# Altium schematic sheet Power_20_12V.SchDoc
size A4
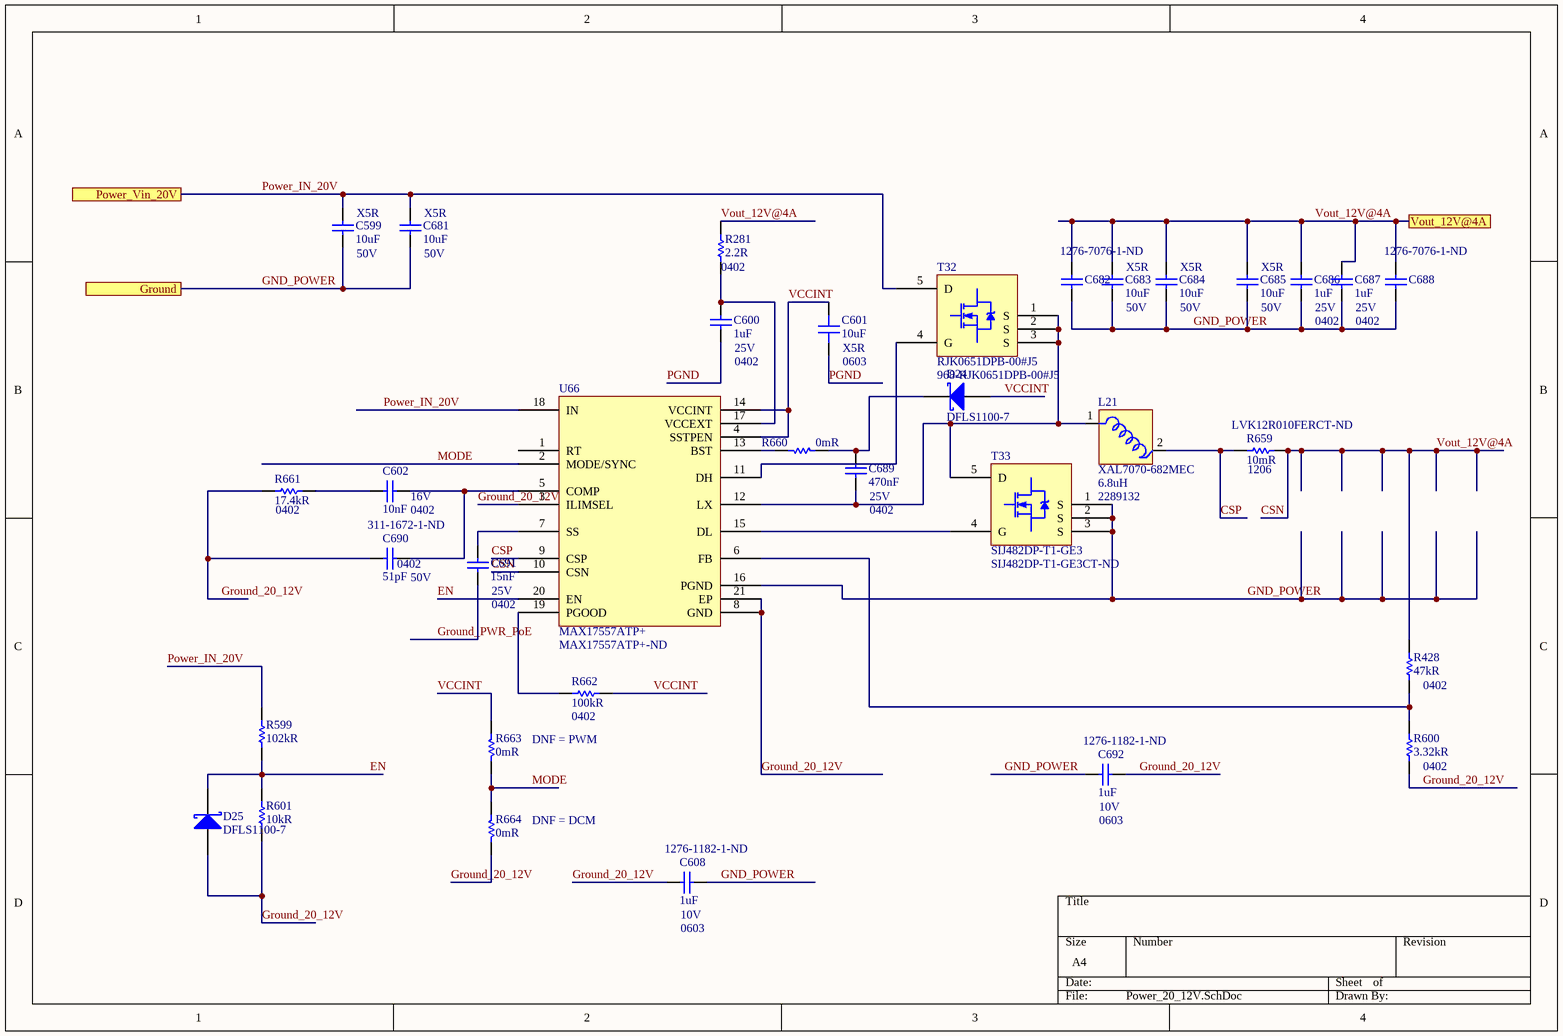
[diagram p0: Power_20_12V.SchDoc]

## Parts
C599  10uF  Voltage Rating (DC): 50V  Dielectric: X5R  [CAP 0805/2012 RF]
C600  1uF  Case/Package: 0402  Voltage Rating: 25V  [CAP 0402/1005 RF]
C601  10uF  Case/Package: 0603  Dielectric: X5R  [CAP 0603/1608 RF]
C602  10nF  Case/Package: 0402  Voltage Rating: 16V  [CAP 0402/1005 RF]
C608  1uF  Supplier Part Number 1: 1276-1182-1-ND  Case/Package: 0603  Voltage Rating: 10V  [CAP 0603/1608 RF]
C681  10uF  Voltage Rating (DC): 50V  Dielectric: X5R  [CAP 0805/2012 RF]
C682  Supplier Part Number 1: 1276-7076-1-ND  [CAP 0603/1608 RF]  (hidden comment: 22uF)
C683  10uF  Voltage Rating (DC): 50V  Dielectric: X5R  [CAP 0805/2012 RF]
C684  10uF  Voltage Rating (DC): 50V  Dielectric: X5R  [CAP 0805/2012 RF]
C685  10uF  Voltage Rating (DC): 50V  Dielectric: X5R  [CAP 0805/2012 RF]
C686  1uF  Case/Package: 0402  Voltage Rating: 25V  [CAP 0402/1005 RF]
C687  1uF  Case/Package: 0402  Voltage Rating: 25V  [CAP 0402/1005 RF]
C688  Supplier Part Number 1: 1276-7076-1-ND  [CAP 0603/1608 RF]  (hidden comment: 22uF)
C689  470nF  Case/Package: 0402  Voltage Rating: 25V  [CAP 0402/1005 RF]
C690  51pF  Supplier Part Number 1: 311-1672-1-ND  Case/Package: 0402  Voltage Rating: 50V  [CAP 0402/1005 RF]
C691  15nF  Case/Package: 0402  Voltage Rating: 25V  [CAP 0402/1005 RF]
C692  1uF  Supplier Part Number 1: 1276-1182-1-ND  Case/Package: 0603  Voltage Rating: 10V  [CAP 0603/1608 RF]
D24  DFLS1100-7  [DFLS1100]
D25  DFLS1100-7  [DFLS1100]
L21  XAL7070-682MEC  Inductance: 6.8uH  Supplier Part Number 1: 2289132
R281  2.2R  Case Code (Imperial): 0402  [RES 0402/1005 RF]
R428  47kR  Case/Package: 0402  [RES 0402/1005 RF]
R599  102kR  [RES 1206/3216]
R600  3.32kR  Case/Package: 0402  [RES 0402/1005 RF]
R601  10kR  [RES 0402/1005 RF]
R659  10mR  Supplier Part Number 1: LVK12R010FERCT-ND  Case/Package: 1206  [RES 1206/3216]
R660  0mR  [RES 0402/1005 RF]
R661  17.4kR  Case/Package: 0402  [RES 0402/1005 RF]
R662  100kR  Case/Package: 0402  [RES 0402/1005 RF]
R663  0mR  [RES 0402/1005 RF]
R664  0mR  [RES 0402/1005 RF]
T32  RJK0651DPB-00#J5  Supplier Part Number 1: 968-RJK0651DPB-00#J5  [RJK0651DPB]
T33  SIJ482DP-T1-GE3  Supplier Part Number 1: SIJ482DP-T1-GE3CT-ND  [SiJ482DP]
U66  MAX17557ATP+  Supplier Part Number 1: MAX17557ATP+-ND  [MAX17557]

## Ports
Ground, Power_Vin_20V, Vout_12V@4A

## Nets
CSN: C682.2 C683.2 C684.2 C685.2 C686.2 C687.2 C688.2 R281.2 R428.2 R659.2 U66.10(CSN) ; port Vout_12V@4A  [also labelled Vout_12V@4A]
CSP: L21.2 R659.1 U66.9(CSP)
EN: D25.1(K) R599.1 R601.1 U66.20(EN)
GND_POWER: C599.1 C608.2 C681.1 C682.1 C683.1 C684.1 C685.1 C686.1 C687.1 C688.1 C692.1 T33.1(S) T33.2(S) T33.3(S) U66.16(PGND) ; port Ground
Ground_20_12V: C608.1 C690.2 C692.2 D25.2(A) R600.1 R601.2 R661.1 R664.2 U66.3(ILIMSEL) U66.8(GND) U66.21(EP)
Ground_PWR_PoE: C691.1
MODE: R663.2 R664.1 U66.2(MODE/SYNC)
PGND: C600.1 C601.1
Power_IN_20V: C599.2 C681.2 R599.2 T32.5(D) U66.18(IN) ; port Power_Vin_20V
VCCINT: C601.2 D24.2(A) R662.1 R663.1 U66.4(SSTPEN) U66.14(VCCINT)
NetC600_2: C600.2 R281.1 U66.17(VCCEXT)
NetC602_1: C602.1 R661.2
NetC602_2: C602.2 C690.1 U66.5(COMP)
NetC689_1: C689.1 L21.1 T32.1(S) T32.2(S) T32.3(S) T33.5(D) U66.12(LX)
NetC689_2: C689.2 D24.1(K) R660.1
NetC691_2: C691.2 U66.7(SS)
NetR428_1: R428.1 R600.2 U66.6(FB)
NetR660_2: R660.2 U66.13(BST)
NetR662_2: R662.2 U66.19(PGOOD)
NetT32_4: T32.4(G) U66.11(DH)
NetT33_4: T33.4(G) U66.15(DL)

Not connected (* = marked no-connect by the designer): U66 1(RT)

## Notes on the sheet
- DNF = PWM
- (near R664) DNF = DCM

## Library data of the parts
C599 C681 C683-C685 = Capacitor: Manufacturer: Murata; Manufacturer Part Number: GRM21BR61H106KE43L; Tolerance: 10%; Supplier 1: Digi-Key; Supplier Part Number 1: 490-18663-1-ND; RoHS: No; Category: Ceramic Capacitors; Stock 1: 3437; Pricing 1: 1=0,49000, 10=0,33800, 100=0,20270, 500=0,15198, 1000=0,12835 (USD); Capacitance: 10uF; Length: 2mm; Width: 1.25mm; Thickness: 1.25mm
C600 C686 C687 = Capacitor: MURATA - GRT155R61E105KE01D - SMD Multilayer Ceramic Capacitor, 1 µF, 25 V, 0402 [1005 Metric], ± 10%, X5R, GRT Series - SMD Multilayer Ceramic Capacitor, 1 µF, 25 V, 0402 [1005 Metric], ± 10%, X5R, GRT Series; Supplier 1: Digi-Key; Supplier Part Number 1: 490-12263-1-ND; Manufacturer: Murata; Manufacturer Part Number: GRT155R61E105KE01D; RoHS: Yes; Category: Ceramic Capacitors; Stock 1: 341453; Pricing 1: 1=0,18000, 10=0,12300, 100=0,06210, 500=0,04248, 1000=0,03758, 2500=0,03594, 5000=0,03268 (USD); Mount: Surface Mount; Case Code (Metric): 1005; Case Code (Imperial): 0402; Min Operating Temperature: -55°C; Max Operating Temperature: 85°C; Packaging: Tape and Reel; Capacitance: 1uF; Tolerance: 10%; Dielectric: X5R; Voltage Rating (DC): 25V; Length: 0.039inch; Width: 0.02inch; Thickness: 0.022inch; Ratings: AEC-Q200; ComponentLink1URL: http://www.farnell.com/datasheets/2165918.pdf?src-supplier=Farnell; ComponentLink1Description: http://www.farnell.com/datasheets/2165918.pdf?src-supplier=Farnell; ComponentLink2URL: http://search.murata.co.jp/Ceramy/image/img/A01X/G101/ENG/GRT155R61E105KE01-01.pdf?src-supplier=Digi-Key; ComponentLink2Description: http://search.murata.co.jp/Ceramy/image/img/A01X/G101/ENG/GRT155R61E105KE01-01.pdf?src-supplier=Digi-Key; ComponentLink3URL: http://www.farnell.com/datasheets/2165918.pdf?src-supplier=Element14; ComponentLink3Description: http://www.farnell.com/datasheets/2165918.pdf?src-supplier=Element14
C601 = Capacitor: Manufacturer: Murata; Manufacturer Part Number: GRM188R61A106KE69D; Tolerance: 10%; Voltage Rating: 10V; Supplier 1: Digi-Key; Supplier Part Number 1: 490-10474-1-ND; Stock 1: 4597169; Pricing 1: 1 = 0,21000, 10 = 0,14000, 100 = 0,07110, 500 = 0,04864, 1000 = 0,04303 (USD); RoHS: Yes; Mount: Surface Mount; Case Code (Metric): 1608; Case Code (Imperial): 0603; Min Operating Temperature: -55°C; Max Operating Temperature: 85°C; Capacitance: 10uF; Packaging: Tape and Reel; Voltage: 10V; Voltage Rating (DC): 10V; Length: 1.6mm; Height: 0.8mm; Width: 0.031inch; Thickness: 0.037inch; Depth: 0.8mm; REACH SVHC: No SVHC; Lead Free: Lead Free; ComponentLink1URL: http://components.arrow.com/part/dataview/0323_07281717?src-supplier=Arrow+Europe; ComponentLink1Description: http://components.arrow.com/part/dataview/0323_07281717?src-supplier=Arrow+Europe; ComponentLink2URL: http://www.farnell.com/datasheets/1955682.pdf?src-supplier=Farnell; ComponentLink2Description: http://www.farnell.com/datasheets/1955682.pdf?src-supplier=Farnell; ComponentLink3URL: http://www.mouser.com/ds/2/281/c02e-2905.pdf?src-supplier=Mouser; ComponentLink3Description: http://www.mouser.com/ds/2/281/c02e-2905.pdf?src-supplier=Mouser; ComponentLink4URL: http://search.murata.co.jp/Ceramy/image/img/A01X/G101/ENG/GRM188R61A106KE69-01.pdf?src-supplier=Digi-Key; ComponentLink4Description: http://search.murata.co.jp/Ceramy/image/img/A01X/G101/ENG/GRM188R61A106KE69-01.pdf?src-supplier=Digi-Key; ComponentLink5URL: http://www.farnell.com/datasheets/1955682.pdf?src-supplier=Element14; ComponentLink5Description: http://www.farnell.com/datasheets/1955682.pdf?src-supplier=Element14; ComponentLink6URL: http://www.farnell.com/datasheets/1955682.pdf?src-supplier=Newark; ComponentLink6Description: http://www.farnell.com/datasheets/1955682.pdf?src-supplier=Newark; ComponentLink7URL: http://psearch.en.murata.com/capacitor/product/GRM188R61A106KE69%23.pdf?src-supplier=Avnet; ComponentLink7Description: http://psearch.en.murata.com/capacitor/product/GRM188R61A106KE69%23.pdf?src-supplier=Avnet
C602 = Capacitor: CAP CER 10000PF 16V X7R 0402; Manufacturer: Yageo; Manufacturer Part Number: CC0402KRX7R7BB103; Tolerance: 10%; Insulation Resistance: 10GR; Dissipation Factor: 3.5%; Supplier 1: Digi-Key; Supplier Part Number 1: 311-1042-6-ND; RoHS: Yes; Category: Ceramic Capacitors; Stock 1: 462633; Pricing 1: 1=0,10000, 10=0,02000, 100=0,00900, 500=0,00642, 1000=0,00505, 2500=0,00459, 5000=0,00423 (USD); Mount: Surface Mount; Number of Pins: 2; Case Code (Metric): 1005; Case Code (Imperial): 0402; Min Operating Temperature: -55°C; Max Operating Temperature: 125°C; Package Quantity: 1; Capacitance: 10nF; Packaging: Tape and Reel; Voltage Rating (DC): 16V; Dielectric: X7R; Termination: SMD/SMT; Voltage: 16V; Length: 1mm; Height: 0.5mm; Width: 0.02inch; Thickness: 0.022inch; Depth: 0.5mm; Radiation Hardening: No; REACH SVHC: No SVHC; Lead Free: Lead Free; Halogen Free: Halogen Free; ComponentLink1URL: https://datasheet.ciiva.com/143/upy-gphc-x7r-6-3v-to-50v-8-143952.pdf?src-supplier=Digi-Key; ComponentLink1Description: https://datasheet.ciiva.com/143/upy-gphc-x7r-6-3v-to-50v-8-143952.pdf?src-supplier=Digi-Key; ComponentLink2URL: https://datasheet.ciiva.com/143/mlccorderingcode-143950.pdf?src-supplier=Digi-Key; ComponentLink2Description: https://datasheet.ciiva.com/143/mlccorderingcode-143950.pdf?src-supplier=Digi-Key; ComponentLink3URL: https://datasheet.ciiva.com/143/mlccorderingcode-143951.pdf?src-supplier=Digi-Key; ComponentLink3Description: https://datasheet.ciiva.com/143/mlccorderingcode-143951.pdf?src-supplier=Digi-Key; ComponentLink4URL: https://datasheet.ciiva.com/16625/upy-gphc-x7r-6-3v-to-50v-8-16625510.pdf?src-supplier=Avnet+Europe; ComponentLink4Description: https://datasheet.ciiva.com/16625/upy-gphc-x7r-6-3v-to-50v-8-16625510.pdf?src-supplier=Avnet+Europe; ComponentLink5URL: https://datasheet.ciiva.com/8033/70765-8033655.pdf?src-supplier=Element14; ComponentLink5Description: https://datasheet.ciiva.com/8033/70765-8033655.pdf?src-supplier=Element14; ComponentLink6URL: https://datasheet.ciiva.com/8033/1489800-8033658.pdf?src-supplier=Element14; ComponentLink6Description: https://datasheet.ciiva.com/8033/1489800-8033658.pdf?src-supplier=Element14; ComponentLink7URL: https://datasheet.ciiva.com/28450/1489800-28450330.pdf?src-supplier=Element14; ComponentLink7Description: https://datasheet.ciiva.com/28450/1489800-28450330.pdf?src-supplier=Element14; ComponentLink8URL: https://datasheet.ciiva.com/8033/1489800-8033659.pdf?src-supplier=Element14; ComponentLink8Description: https://datasheet.ciiva.com/8033/1489800-8033659.pdf?src-supplier=Element14; ComponentLink9URL: https://datasheet.ciiva.com/7978/1489800-7978109.pdf?src-supplier=Element14; ComponentLink9Description: https://datasheet.ciiva.com/7978/1489800-7978109.pdf?src-supplier=Element14; ComponentLink10URL: https://datasheet.ciiva.com/5425/upy-gp-np0-16v-to-50v-8-3714-5425438.pdf?src-supplier=Mouser; ComponentLink10Description: https://datasheet.ciiva.com/5425/upy-gp-np0-16v-to-50v-8-3714-5425438.pdf?src-supplier=Mouser
C608 C692 = Capacitor: Cap Ceramic 1uF 10V X5R 10% SMD 0603 85C Paper T/R; Manufacturer: Samsung; Manufacturer Part Number: CL10A105KP8NNNC; Supplier 1: Digi-Key; RoHS: Yes; Category: Ceramic Capacitors; Stock 1: 3646234; Pricing 1: 1=0,10000, 10=0,03600, 100=0,01610, 500=0,01152, 1000=0,00905 (USD); Mount: Surface Mount; Case Code (Metric): 1608; Case Code (Imperial): 0603; Contact Plating: Tin; Min Operating Temperature: -55°C; Max Operating Temperature: 85°C; Tolerance: 10%; Packaging: Tape and Reel; Package Quantity: 1; Capacitance: 1uF; Dielectric: X5R; Voltage: 10V; Length: 1.6mm; Height: 0.8mm; Width: 0.031inch; Thickness: 0.035inch; Depth: 0.8mm; Radiation Hardening: No; ComponentLink1URL: https://datasheet.ciiva.com/15195/getdatasheetpartid-358616-15195708.pdf?src-supplier=Verical; ComponentLink1Description: https://datasheet.ciiva.com/15195/getdatasheetpartid-358616-15195708.pdf?src-supplier=Verical; ComponentLink2URL: https://datasheet.ciiva.com/16358/cl05b104kq5nnnc-16358431.pdf?src-supplier=Future+Electronics; ComponentLink2Description: https://datasheet.ciiva.com/16358/cl05b104kq5nnnc-16358431.pdf?src-supplier=Future+Electronics
C682 C688 = Capacitor: CAP CER 22UF 16V X5R 0603; Manufacturer: Samsung; Manufacturer Part Number: CL10A226MO7JZNC; Supplier 1: Digi-Key; RoHS: No; Category: Ceramic Capacitors; Stock 1: 234621; Pricing 1: 1=0,73000, 10=0,51500, 100=0,33910, 500=0,25118, 1000=0,21350 (USD); ComponentLink1URL: http://www.samsungsem.com/kr/support/product-search/mlcc/CL10A226MO7JZNC.jsp?src-supplier=Digi-Key; ComponentLink1Description: http://www.samsungsem.com/kr/support/product-search/mlcc/CL10A226MO7JZNC.jsp?src-supplier=Digi-Key
C689 = Capacitor: CAP CER 0.47UF 25V X5R 0402; Manufacturer: Murata; Manufacturer Part Number: GRT155R61E474KE01D; Tolerance: 10%; Supplier 1: Digi-Key; Supplier Part Number 1: 490-12269-1-ND; RoHS: Yes; Category: Ceramic Capacitors; Stock 1: 188291; Pricing 1: 1=0,12000, 10=0,08400, 100=0,03930, 500=0,02754, 1000=0,02280, 2500=0,02122, 5000=0,01941 (USD); Mount: Surface Mount; Case Code (Metric): 1005; Case Code (Imperial): 0402; Min Operating Temperature: -55°C; Max Operating Temperature: 85°C; Packaging: Tape and Reel; Capacitance: 470nF; Length: 0.039inch; Width: 0.02inch; Thickness: 0.022inch; Ratings: AEC-Q200; ComponentLink1URL: http://search.murata.co.jp/Ceramy/image/img/A01X/G101/ENG/GRT155R61E474KE01-01.pdf?src-supplier=Digi-Key; ComponentLink1Description: http://search.murata.co.jp/Ceramy/image/img/A01X/G101/ENG/GRT155R61E474KE01-01.pdf?src-supplier=Digi-Key
C690 = Capacitor: Cap Ceramic 51pF 50V C0G 5% SMD 0402 125C Paper T/R; Manufacturer: Yageo; Manufacturer Part Number: CC0402JRNPO9BN510; Supplier 1: Digi-Key; RoHS: Yes; Category: Ceramic Capacitors; Stock 1: 37326; Pricing 1: 1=0,10000, 10=0,04700, 100=0,02080, 500=0,01482, 1000=0,01165, 2500=0,01059, 5000=0,00974 (USD); Mount: Surface Mount; Weight: 2.3E-05oz; Case Code (Imperial): 0402; Case Code (Metric): 1005; Min Operating Temperature: -55°C; Max Operating Temperature: 125°C; Capacitance: 51pF; Tolerance: 5%; Packaging: Tape and Reel; Voltage Rating (DC): 50V; Dielectric: C0G; Termination: SMD/SMT; Composition: Ceramic; Length: 1mm; Width: 0.02inch; Thickness: 0.022inch; Depth: 0.5mm; Radiation Hardening: No; Lead Free: Lead Free; ComponentLink1URL: https://datasheet.ciiva.com/26862/getdatasheetpartid-688242-26862601.pdf?src-supplier=Verical; ComponentLink1Description: https://datasheet.ciiva.com/26862/getdatasheetpartid-688242-26862601.pdf?src-supplier=Verical; ComponentLink2URL: https://datasheet.ciiva.com/13263/upy-gp-np0-16v-to-50v-8-3714-13263293.pdf?src-supplier=Mouser; ComponentLink2Description: https://datasheet.ciiva.com/13263/upy-gp-np0-16v-to-50v-8-3714-13263293.pdf?src-supplier=Mouser
C691 = Capacitor: Cap Ceramic 0.015uF 25V X7R 10% SMD 0402 125C Paper T/R; Manufacturer: Yageo; Manufacturer Part Number: CC0402KRX7R8BB153; Supplier 1: Digi-Key; Supplier Part Number 1: 311-1713-1-ND; RoHS: Yes; Category: Ceramic Capacitors; Stock 1: 34974; Pricing 1: 1=0,10000, 10=0,04300, 100=0,01920, 500=0,01374, 1000=0,01080, 2500=0,00982, 5000=0,00903 (USD); Mount: Surface Mount; Weight: 2.3E-05oz; Case Code (Imperial): 0402; Case Code (Metric): 1005; Min Operating Temperature: -55°C; Max Operating Temperature: 125°C; Tolerance: 10%; Packaging: Tape and Reel; Capacitance: 15nF; Voltage Rating (DC): 25V; Dielectric: X7R; Termination: SMD/SMT; Composition: Ceramic; Length: 1mm; Height: 0.5mm; Width: 0.02inch; Thickness: 0.022inch; Depth: 0.5mm; Radiation Hardening: No; Lead Free: Lead Free; Halogen Free: Halogen Free; ComponentLink1URL: https://datasheet.ciiva.com/13208/upy-gphc-x7r-6-3v-to-50v-8-12304-13208892.pdf?src-supplier=Mouser; ComponentLink1Description: https://datasheet.ciiva.com/13208/upy-gphc-x7r-6-3v-to-50v-8-12304-13208892.pdf?src-supplier=Mouser; ComponentLink2URL: https://datasheet.ciiva.com/17437/upy-gphc-x7r-6-3v-to-50v-8-17437359.pdf?src-supplier=Avnet+Europe; ComponentLink2Description: https://datasheet.ciiva.com/17437/upy-gphc-x7r-6-3v-to-50v-8-17437359.pdf?src-supplier=Avnet+Europe; ComponentLink3URL: https://datasheet.ciiva.com/11464/upy-gphc-x7r-6-3v-to-50v-8-11464890.pdf?src-supplier=Avnet; ComponentLink3Description: https://datasheet.ciiva.com/11464/upy-gphc-x7r-6-3v-to-50v-8-11464890.pdf?src-supplier=Avnet; ComponentLink4URL: https://datasheet.ciiva.com/26829/getdatasheetpartid-748495-26829322.pdf?src-supplier=Verical; ComponentLink4Description: https://datasheet.ciiva.com/26829/getdatasheetpartid-748495-26829322.pdf?src-supplier=Verical
D24 D25 = DFLS1100-7: DIODE SCHOTTKY 100V POWERDI123; Manufacturer: Diodes; Forward Voltage: 770mV; Forward Current: 1A; Peak Reverse Current: 1uA; Peak Non-Repetitive Surge Current: 50A; Max Forward Surge Current (Ifsm): 40A; Element Configuration: Single; Polarity: Standard; Capacitance: 36pF; Supplier 1: Digi-Key; Manufacturer Part Number: DFLS1100-7; RoHS: Yes; Category: Rectifier Diodes; Stock 1: 113187; Pricing 1: 1=0,41000, 10=0,35100, 25=0,32760, 100=0,24340, 250=0,23120, 500=0,19000, 1000=0,15444 (USD); Mount: Surface Mount; Number of Pins: 2; Min Operating Temperature: -55°C; Max Operating Temperature: 175°C; Packaging: Tape and Reel; Package Quantity: 3000; Average Rectified Current: 1A; Max Repetitive Reverse Voltage (Vrrm): 100V; Termination: SMD/SMT; Voltage Rating (DC): 100V; Current Rating: 1A; Output Current: 1A; Max Reverse Voltage (DC): 100V; Length: 2.8mm; Height: 0.98mm; Width: 1.78mm; Radiation Hardening: No; REACH SVHC: No SVHC; Lead Free: Lead Free; ComponentLink1URL: https://datasheet.ciiva.com/6932/ds30497-6932064.pdf?src-supplier=Newark; ComponentLink1Description: https://datasheet.ciiva.com/6932/ds30497-6932064.pdf?src-supplier=Newark; ComponentLink2URL: https://datasheet.ciiva.com/4715/ds30497-81105-4715653.pdf?src-supplier=Mouser; ComponentLink2Description: https://datasheet.ciiva.com/4715/ds30497-81105-4715653.pdf?src-supplier=Mouser; ComponentLink3URL: https://datasheet.ciiva.com/4245/2460ds30497-4245287.pdf?src-supplier=Arrow; ComponentLink3Description: https://datasheet.ciiva.com/4245/2460ds30497-4245287.pdf?src-supplier=Arrow; ComponentLink4URL: https://datasheet.ciiva.com/15144/getdatasheetpartid-44146-15144126.pdf?src-supplier=Verical; ComponentLink4Description: https://datasheet.ciiva.com/15144/getdatasheetpartid-44146-15144126.pdf?src-supplier=Verical; ComponentLink5URL: https://datasheet.ciiva.com/26788/dfls1100-7-26788776.pdf?src-supplier=IIIC; ComponentLink5Description: https://datasheet.ciiva.com/26788/dfls1100-7-26788776.pdf?src-supplier=IIIC; ComponentLink6URL: https://datasheet.ciiva.com/914/ds30497-914548.pdf?src-supplier=Digi-Key; ComponentLink6Description: https://datasheet.ciiva.com/914/ds30497-914548.pdf?src-supplier=Digi-Key; ComponentLink7URL: https://datasheet.ciiva.com/914/ds30497-914549.pdf?src-supplier=Digi-Key; ComponentLink7Description: https://datasheet.ciiva.com/914/ds30497-914549.pdf?src-supplier=Digi-Key; ComponentLink8URL: https://datasheet.ciiva.com/914/ds30497-914550.pdf?src-supplier=Digi-Key; ComponentLink8Description: https://datasheet.ciiva.com/914/ds30497-914550.pdf?src-supplier=Digi-Key; ComponentLink9URL: https://datasheet.ciiva.com/7964/ds30497-7964246.pdf?src-supplier=Element14; ComponentLink9Description: https://datasheet.ciiva.com/7964/ds30497-7964246.pdf?src-supplier=Element14; ComponentLink10URL: https://datasheet.ciiva.com/22695/1915475-22695803.pdf?src-supplier=Element14; ComponentLink10Description: https://datasheet.ciiva.com/22695/1915475-22695803.pdf?src-supplier=Element14; Supplier Part Number 1: DFLS1100DICT-ND
L21 = XAL7070-682MEC: Power inductor, shielded, 20% tol, SMT, RoHS, halogen f; Manufacturer: Coilcraft; Core Material: Composite; Max DC Current: 9.2A; Self Resonant Frequency: 20MHz; DC Resistance (DCR): 19.62mR; Test Frequency: 100kHz; Saturation Current: 12.8A; Supplier 1: Farnell; Manufacturer Part Number: XAL7070-682MEC; RoHS: Yes; Category: Fixed Inductors; Stock 1: 301; Mount: Surface Mount; Case/Package: SMD/SMT; Min Operating Temperature: -40°C; Max Operating Temperature: 125°C; Packaging: Tape and Reel; Tolerance: 20%; Termination: SMD/SMT; Package Quantity: 150; Shielding: Shielded; Inductance Tolerance: 20%; RMS Current (Irms): 9.2A; Length: 8mm; Height: 7mm; Width: 7.7mm; Lead Free: Contains Lead; REACH SVHC: No SVHC; ComponentLink1URL: https://datasheet.ciiva.com/22680/1681997-22680423.pdf?src-supplier=Element14; ComponentLink1Description: https://datasheet.ciiva.com/22680/1681997-22680423.pdf?src-supplier=Element14; ComponentLink2URL: https://datasheet.ciiva.com/22680/1681997-22680424.pdf?src-supplier=Element14; ComponentLink2Description: https://datasheet.ciiva.com/22680/1681997-22680424.pdf?src-supplier=Element14; ComponentLink3URL: https://datasheet.ciiva.com/22701/1681997-22701599.pdf?src-supplier=Element14; ComponentLink3Description: https://datasheet.ciiva.com/22701/1681997-22701599.pdf?src-supplier=Element14
R281 = Resistor: RES SMD 2.2 OHM 5% 1/16W 0402; Manufacturer: Yageo; Manufacturer Part Number: RC0402JR-072R2L; Power Rating: 62.5mW; Voltage Rating: 50V; Temperature Coefficient: 200ppm/°C; Max Power Dissipation: 63mW; Supplier 1: Digi-Key; Supplier Part Number 1: 311-2.2JRCT-ND; RoHS: Yes; Category: Chip SMD Resistors; Stock 1: 928927; Pricing 1: 1=0,10000, 10=0,01900, 100=0,00760, 1000=0,00342, 2500=0,00297, 5000=0,00245 (USD); Case/Package: 0402; Number of Pins: 2; Case Code (Metric): 1005; Contact Plating: Tin,Matte,Lead; Min Operating Temperature: -55°C; Max Operating Temperature: 155°C; Resistance: 2.2R; Tolerance: 5%; Packaging: Tape and Reel; Package Quantity: 1; Composition: Thick Film; Number of Terminations: 2; Termination: SMD/SMT; Military Standard: Not; Features: Moisture Resistant; Voltage Rating (DC): 50V; Working Voltage: 50V; Length: 1mm; Height: 0.016inch; Width: 0.02inch; Depth: 0.5mm; Radiation Hardening: No; REACH SVHC: No SVHC; Lead Free: Lead Free; ComponentLink1URL: https://datasheet.ciiva.com/2452/pyu-r-int-thick-7-2452737.pdf?src-supplier=Digi-Key; ComponentLink1Description: https://datasheet.ciiva.com/2452/pyu-r-int-thick-7-2452737.pdf?src-supplier=Digi-Key; ComponentLink2URL: https://datasheet.ciiva.com/2452/pyu-r-int-thick-7-2452738.pdf?src-supplier=Digi-Key; ComponentLink2Description: https://datasheet.ciiva.com/2452/pyu-r-int-thick-7-2452738.pdf?src-supplier=Digi-Key; ComponentLink3URL: https://datasheet.ciiva.com/2452/pyu-r-int-thick-7-2452739.pdf?src-supplier=Digi-Key; ComponentLink3Description: https://datasheet.ciiva.com/2452/pyu-r-int-thick-7-2452739.pdf?src-supplier=Digi-Key; ComponentLink4URL: https://datasheet.ciiva.com/28639/1018594-28639893.pdf?src-supplier=Element14; ComponentLink4Description: https://datasheet.ciiva.com/28639/1018594-28639893.pdf?src-supplier=Element14; ComponentLink5URL: https://datasheet.ciiva.com/28415/pyu-rc0402-51-rohs-l-6-28415222.pdf?src-supplier=Avnet+Europe; ComponentLink5Description: https://datasheet.ciiva.com/28415/pyu-rc0402-51-rohs-l-6-28415222.pdf?src-supplier=Avnet+Europe; ComponentLink6URL: https://datasheet.ciiva.com/16863/pyu-rc0402-51-rohs-l-6-16863111.pdf?src-supplier=Avnet+Europe; ComponentLink6Description: https://datasheet.ciiva.com/16863/pyu-rc0402-51-rohs-l-6-16863111.pdf?src-supplier=Avnet+Europe; ComponentLink7URL: https://datasheet.ciiva.com/8894/pyu-rc0402-51-rohs-l-6-8894569.pdf?src-supplier=Avnet; ComponentLink7Description: https://datasheet.ciiva.com/8894/pyu-rc0402-51-rohs-l-6-8894569.pdf?src-supplier=Avnet; ComponentLink8URL: https://datasheet.ciiva.com/15189/getdatasheetpartid-470524-15189562.pdf?src-supplier=Verical; ComponentLink8Description: https://datasheet.ciiva.com/15189/getdatasheetpartid-470524-15189562.pdf?src-supplier=Verical; ComponentLink9URL: https://datasheet.ciiva.com/12557/pyu-rc0402-51-rohs-l-6-r-8721-12557918.pdf?src-supplier=Mouser; ComponentLink9Description: https://datasheet.ciiva.com/12557/pyu-rc0402-51-rohs-l-6-r-8721-12557918.pdf?src-supplier=Mouser
R428 = Resistor: RES SMD 47K OHM 0.1% 1/16W 0402; Manufacturer: Panasonic; Manufacturer Part Number: ERA-2AEB473X; Power Rating: 63mW; Voltage Rating: 25V; Temperature Coefficient: 25ppm/°C; Supplier 1: Digi-Key; Supplier Part Number 1: P47KDCCT-ND; RoHS: Yes; Category: Chip SMD Resistors; Stock 1: 81717; Pricing 1: 1=0,45000, 10=0,32100, 100=0,12830, 1000=0,06322, 2500=0,05858, 5000=0,05300 (USD); Mount: Surface Mount; Case Code (Metric): 1005; Case Code (Imperial): 0402; Contact Plating: Tin; Min Operating Temperature: -55°C; Max Operating Temperature: 155°C; Packaging: Tape and Reel; Resistance: 47kR; Tolerance: 0.1%; Package Quantity: 10000; Composition: Thin Film,Metal Film; Number of Terminations: 2; Military Standard: Not; Max Power Dissipation: 63mW; Voltage Rating (DC): 25V; Length: 1mm; Height: 0.35mm; Width: 0.02inch; Depth: 0.5mm; Radiation Hardening: No; REACH SVHC: Unknown; Lead Free: Lead Free; ComponentLink1URL: https://datasheet.ciiva.com/11812/0900766b80beefcc-11812680.pdf?src-supplier=RSComponents; ComponentLink1Description: https://datasheet.ciiva.com/11812/0900766b80beefcc-11812680.pdf?src-supplier=RSComponents; ComponentLink2URL: https://datasheet.ciiva.com/22740/1776116-22740313.pdf?src-supplier=Element14; ComponentLink2Description: https://datasheet.ciiva.com/22740/1776116-22740313.pdf?src-supplier=Element14; ComponentLink3URL: https://datasheet.ciiva.com/30096/54aoa0000ce26-30096458.pdf?src-supplier=Onlinecomponents.com; ComponentLink3Description: https://datasheet.ciiva.com/30096/54aoa0000ce26-30096458.pdf?src-supplier=Onlinecomponents.com; ComponentLink4URL: https://datasheet.ciiva.com/25720/1776116-25720587.pdf?src-supplier=Farnell; ComponentLink4Description: https://datasheet.ciiva.com/25720/1776116-25720587.pdf?src-supplier=Farnell
R599 = Resistor: RES 102K OHM 1% 1/16W 0402; Manufacturer: Stackpole Electronics; Manufacturer Part Number: RMCF0402FT102K; Power Rating: 62.5mW; Max Power Dissipation: 63mW; Temperature Coefficient: 100ppm/°C; Supplier 1: Digi-Key; Supplier Part Number 1: RMCF0402FT102KCT-ND; RoHS: Yes; Category: Chip SMD Resistors; Stock 1: 54547; Pricing 1: 1=0,10000, 10=0,01400, 100=0,00580, 1000=0,00262, 2500=0,00228, 5000=0,00188 (USD); Mount: Surface Mount; Case/Package: 0402; Case Code (Metric): 1005; Case Code (Imperial): 0402; Contact Plating: Tin,Matte; Min Operating Temperature: -55°C; Max Operating Temperature: 155°C; Resistance: 102kR; Tolerance: 1%; Packaging: Tape and Reel; Composition: Thick Film; Number of Terminations: 2; Features: Automotive AEC-Q200; Length: 0.039inch; Height: 0.016inch; Width: 0.02inch; Radiation Hardening: No; Lead Free: Lead Free; ComponentLink1URL: https://www.seielect.com/Catalog/SEI-RMCF_RMCP.pdf?src-supplier=Digi-Key; ComponentLink1Description: https://www.seielect.com/Catalog/SEI-RMCF_RMCP.pdf?src-supplier=Digi-Key; ComponentLink2URL: https://www.seielect.com/catalog/SEI-RMCF_RMCP.pdf?src-supplier=Avnet; ComponentLink2Description: https://www.seielect.com/catalog/SEI-RMCF_RMCP.pdf?src-supplier=Avnet; ComponentLink3URL: https://www.seielect.com/catalog/SEI-RMCF_RMCP.pdf?src-supplier=Avnet+Asia; ComponentLink3Description: https://www.seielect.com/catalog/SEI-RMCF_RMCP.pdf?src-supplier=Avnet+Asia; ComponentLink4URL: https://www.seielect.com/catalog/SEI-Packaging.pdf?src-supplier=Digi-Key; ComponentLink4Description: https://www.seielect.com/catalog/SEI-Packaging.pdf?src-supplier=Digi-Key
R600 = Resistor: RES 3.32K OHM 1% 1/16W 0402; Manufacturer: Stackpole Electronics; Manufacturer Part Number: RMCF0402FT3K32; Max Power Dissipation: 63mW; Temperature Coefficient: 100ppm/°C; Supplier 1: Digi-Key; Supplier Part Number 1: RMCF0402FT3K32CT-ND; RoHS: Yes; Category: Chip SMD Resistors; Stock 1: 202349; Pricing 1: 1=0,10000, 10=0,01400, 100=0,00580, 1000=0,00262, 2500=0,00228, 5000=0,00188 (USD); Mount: Surface Mount; Case Code (Metric): 1005; Case Code (Imperial): 0402; Contact Plating: Tin,Matte; Min Operating Temperature: -55°C; Max Operating Temperature: 155°C; Resistance: 3.32kR; Tolerance: 1%; Packaging: Tape and Reel; Composition: Thick Film; Number of Terminations: 2; Features: Automotive AEC-Q200; Length: 0.039inch; Height: 0.016inch; Width: 0.02inch; Radiation Hardening: No; Lead Free: Lead Free; ComponentLink1URL: http://components.arrow.com/part/dataview/50598099S32184N1174?src-supplier=Arrow; ComponentLink1Description: http://components.arrow.com/part/dataview/50598099S32184N1174?src-supplier=Arrow; ComponentLink2URL: https://www.seielect.com/catalog/SEI-RMCF_RMCP.pdf?src-supplier=Avnet; ComponentLink2Description: https://www.seielect.com/catalog/SEI-RMCF_RMCP.pdf?src-supplier=Avnet; ComponentLink3URL: https://www.seielect.com/catalog/SEI-Packaging.pdf?src-supplier=Digi-Key; ComponentLink3Description: https://www.seielect.com/catalog/SEI-Packaging.pdf?src-supplier=Digi-Key; ComponentLink4URL: https://www.seielect.com/Catalog/SEI-RMCF_RMCP.pdf?src-supplier=Digi-Key; ComponentLink4Description: https://www.seielect.com/Catalog/SEI-RMCF_RMCP.pdf?src-supplier=Digi-Key
R601 = Resistor: Manufacturer 1: Yageo; Manufacturer Part Number 1: RC0402FR-0710KL; Tolerance: 1%; Temperature Coefficient: 100ppm/°C; Voltage Rating: 50V; Power Rating: 62.5mW; Supplier 1: Digi-Key; Supplier Part Number 1: 311-10.0KLRCT-ND; Stock 1: 71214322; Pricing 1: 1=0,10000, 10=0,01500, 100=0,00600, 1000=0,00270, 2500=0,00235, 5000=0,00194 (USD); RoHS: Yes; Case/Package: 0402; Number of Pins: 2; Case Code (Imperial): 0402; Case Code (Metric): 1005; Min Operating Temperature: -55°C; Max Operating Temperature: 155°C; Resistance: 10kR; Packaging: Tape and Reel; Composition: Thick Film; Voltage Rating (DC): 50V; Termination: SMD/SMT; Military Standard: Not; Working Voltage: 50V; Number of Terminations: 2; Length: 1mm; Height: 0.32mm; Width: 0.5mm; Depth: 0.5mm; Lead Pitch: 0.2mm; REACH SVHC: No SVHC; Lead Free: Lead Free; ComponentLink1URL: https://datasheet.ciiva.com/7660/38568-7660787.pdf?src-supplier=Element14; ComponentLink1Description: https://datasheet.ciiva.com/7660/38568-7660787.pdf?src-supplier=Element14; ComponentLink2URL: https://datasheet.ciiva.com/7849/1784430-7849813.pdf?src-supplier=Element14; ComponentLink2Description: https://datasheet.ciiva.com/7849/1784430-7849813.pdf?src-supplier=Element14; ComponentLink3URL: https://datasheet.ciiva.com/7849/1686128-7849814.pdf?src-supplier=Element14; ComponentLink3Description: https://datasheet.ciiva.com/7849/1686128-7849814.pdf?src-supplier=Element14; ComponentLink4URL: https://datasheet.ciiva.com/7849/1784430-7849815.pdf?src-supplier=Element14; ComponentLink4Description: https://datasheet.ciiva.com/7849/1784430-7849815.pdf?src-supplier=Element14; ComponentLink5URL: https://datasheet.ciiva.com/22747/1018594-22747512.pdf?src-supplier=Element14; ComponentLink5Description: https://datasheet.ciiva.com/22747/1018594-22747512.pdf?src-supplier=Element14; ComponentLink6URL: https://datasheet.ciiva.com/12667/pyu-rc0402-51-rohs-l-6-r-12667067.pdf?src-supplier=Mouser; ComponentLink6Description: https://datasheet.ciiva.com/12667/pyu-rc0402-51-rohs-l-6-r-12667067.pdf?src-supplier=Mouser; ComponentLink7URL: https://datasheet.ciiva.com/7983/1018594-7983486.pdf?src-supplier=Element14; ComponentLink7Description: https://datasheet.ciiva.com/7983/1018594-7983486.pdf?src-supplier=Element14
R659 = Resistor: RES 0.01 OHM 1% 1/2W 1206; Manufacturer: Ohmite; Manufacturer Part Number: LVK12R010FER; Power Rating: 500mW; Temperature Coefficient: 50ppm/°C; Supplier 1: Digi-Key; RoHS: Yes; Category: Chip SMD Resistors; Stock 1: 76809; Pricing 1: 1=0,88000, 10=0,76200, 25=0,67000, 50=0,61220, 100=0,53130, 250=0,46200, 500=0,38346, 1000=0,31416 (USD); Mount: Surface Mount; Number of Pins: 4; Case Code (Imperial): 1206; Case Code (Metric): 3216; Min Operating Temperature: -40°C; Max Operating Temperature: 125°C; Packaging: Tape and Reel; Resistance: 10mR; Tolerance: 1%; Package Quantity: 1; Composition: Thick Film,Metal Film,Thin Film; Termination: SMD/SMT; Number of Terminations: 4; Max Power Dissipation: 500mW; Features: Moisture Resistant; Length: 3.2mm; Height: 0.5mm; Width: 1.6mm; Depth: 1.6mm; REACH SVHC: Unknown; ComponentLink1URL: https://datasheet.ciiva.com/2482/res-lvk-2482099.pdf?src-supplier=Digi-Key; ComponentLink1Description: https://datasheet.ciiva.com/2482/res-lvk-2482099.pdf?src-supplier=Digi-Key; ComponentLink2URL: https://datasheet.ciiva.com/2482/res-lvk-2482100.pdf?src-supplier=Digi-Key; ComponentLink2Description: https://datasheet.ciiva.com/2482/res-lvk-2482100.pdf?src-supplier=Digi-Key; ComponentLink3URL: https://datasheet.ciiva.com/7937/575641-7937849.pdf?src-supplier=Element14; ComponentLink3Description: https://datasheet.ciiva.com/7937/575641-7937849.pdf?src-supplier=Element14; ComponentLink4URL: https://datasheet.ciiva.com/7937/575641-7937850.pdf?src-supplier=Element14; ComponentLink4Description: https://datasheet.ciiva.com/7937/575641-7937850.pdf?src-supplier=Element14; ComponentLink5URL: https://datasheet.ciiva.com/16769/70024650-16769439.pdf?src-supplier=Allied+Electronics; ComponentLink5Description: https://datasheet.ciiva.com/16769/70024650-16769439.pdf?src-supplier=Allied+Electronics; ComponentLink6URL: https://datasheet.ciiva.com/2482/res-lvk-2482098.pdf?src-supplier=Digi-Key; ComponentLink6Description: https://datasheet.ciiva.com/2482/res-lvk-2482098.pdf?src-supplier=Digi-Key; ComponentLink7URL: https://datasheet.ciiva.com/46385/575641-46385558.pdf?src-supplier=Element14; ComponentLink7Description: https://datasheet.ciiva.com/46385/575641-46385558.pdf?src-supplier=Element14; ComponentLink8URL: https://datasheet.ciiva.com/15865/40lvk-15865306.pdf?src-supplier=Onlinecomponents.com; ComponentLink8Description: https://datasheet.ciiva.com/15865/40lvk-15865306.pdf?src-supplier=Onlinecomponents.com
R660 R663 R664 = Resistor: Manufacturer 1: Yageo; Manufacturer Part Number 1: RC0402JR-070RL; Power Rating: 62.5mW; Tolerance: 5%; Voltage Rating: 50V; Max Power Dissipation: 63mW; Temperature Coefficient: 200ppm/°C; Supplier 1: Digi-Key; Supplier Part Number 1: 311-0.0JRCT-ND; Stock 1: 69822252; Pricing 1: 1=0.10000, 10=0.01200, 25=0.00920, 50=0.00680, 100=0.00510, 250=0.00388, 500=0.00308, 1000=0.00227, 5000=0.00163 (USD); RoHS: Yes; Case/Package: 0402; Contact Plating: Tin,Matte; Case Code (Metric): 1005; Case Code (Imperial): 0402; Min Operating Temperature: -55°C; Max Operating Temperature: 155°C; Resistance: 0mR; Packaging: Tape and Reel; Composition: Thick Film; Package Quantity: 1; Number of Terminations: 2; Termination: SMD/SMT; Military Standard: Not; Features: Moisture Resistant; Length: 1mm; Height: 0.016inch; Width: 0.02inch; Depth: 0.5mm; Radiation Hardening: No; REACH SVHC: Unknown; Lead Free: Lead Free; ComponentLink1URL: https://datasheet.ciiva.com/2452/pyu-rc0402-51-rohs-l-6-2452608.pdf?src-supplier=Digi-Key; ComponentLink1Description: https://datasheet.ciiva.com/2452/pyu-rc0402-51-rohs-l-6-2452608.pdf?src-supplier=Digi-Key; ComponentLink2URL: https://datasheet.ciiva.com/11808/0900766b80c66297-11808195.pdf?src-supplier=RSComponents; ComponentLink2Description: https://datasheet.ciiva.com/11808/0900766b80c66297-11808195.pdf?src-supplier=RSComponents; ComponentLink3URL: https://datasheet.ciiva.com/2452/pyu-r-int-thick-7-2452609.pdf?src-supplier=Digi-Key; ComponentLink3Description: https://datasheet.ciiva.com/2452/pyu-r-int-thick-7-2452609.pdf?src-supplier=Digi-Key; ComponentLink4URL: https://datasheet.ciiva.com/22747/1018594-22747515.pdf?src-supplier=Element14; ComponentLink4Description: https://datasheet.ciiva.com/22747/1018594-22747515.pdf?src-supplier=Element14; ComponentLink5URL: https://datasheet.ciiva.com/7983/1018594-7983535.pdf?src-supplier=Element14; ComponentLink5Description: https://datasheet.ciiva.com/7983/1018594-7983535.pdf?src-supplier=Element14; ComponentLink6URL: https://datasheet.ciiva.com/2452/pyu-r-int-thick-7-2452610.pdf?src-supplier=Digi-Key; ComponentLink6Description: https://datasheet.ciiva.com/2452/pyu-r-int-thick-7-2452610.pdf?src-supplier=Digi-Key; ComponentLink7URL: https://datasheet.ciiva.com/8896/pyu-rc0402-51-rohs-l-6-8896201.pdf?src-supplier=Avnet; ComponentLink7Description: https://datasheet.ciiva.com/8896/pyu-rc0402-51-rohs-l-6-8896201.pdf?src-supplier=Avnet; ComponentLink8URL: https://datasheet.ciiva.com/28386/pyu-rc0402-51-rohs-l-6-28386633.pdf?src-supplier=Avnet+Europe; ComponentLink8Description: https://datasheet.ciiva.com/28386/pyu-rc0402-51-rohs-l-6-28386633.pdf?src-supplier=Avnet+Europe; ComponentLink9URL: https://datasheet.ciiva.com/15189/getdatasheetpartid-326379-15189533.pdf?src-supplier=Verical; ComponentLink9Description: https://datasheet.ciiva.com/15189/getdatasheetpartid-326379-15189533.pdf?src-supplier=Verical
R661 = Resistor: RES SMD 17.4K OHM 1% 1/16W 0402; Manufacturer: Yageo; Manufacturer Part Number: RC0402FR-0717K4L; Power Rating: 62.5mW; Voltage Rating: 50V; Max Power Dissipation: 63mW; Temperature Coefficient: 100ppm/°C; Supplier 1: Digi-Key; Supplier Part Number 1: 311-17.4KLRCT-ND; RoHS: Yes; Category: Chip SMD Resistors; Stock 1: 1128498; Pricing 1: 1=0,10000, 10=0,01600, 100=0,00640, 1000=0,00289, 2500=0,00251, 5000=0,00207 (USD); Case Code (Metric): 1005; Case Code (Imperial): 0402; Min Operating Temperature: -55°C; Max Operating Temperature: 155°C; Package Quantity: 1; Resistance: 17.4kR; Tolerance: 1%; Packaging: Tape and Reel; Composition: Thick Film; Number of Terminations: 2; Termination: SMD/SMT; Military Standard: Not; Voltage Rating (DC): 50V; Working Voltage: 50V; Features: Moisture Resistant; Length: 1mm; Height: 0.016inch; Width: 0.02inch; Depth: 0.5mm; Lead Free: Lead Free; ComponentLink1URL: https://datasheet.ciiva.com/2453/pyu-r-int-thick-7-2453648.pdf?src-supplier=Digi-Key; ComponentLink1Description: https://datasheet.ciiva.com/2453/pyu-r-int-thick-7-2453648.pdf?src-supplier=Digi-Key; ComponentLink2URL: https://datasheet.ciiva.com/26829/getdatasheetpartid-329233-26829932.pdf?src-supplier=Verical; ComponentLink2Description: https://datasheet.ciiva.com/26829/getdatasheetpartid-329233-26829932.pdf?src-supplier=Verical; ComponentLink3URL: https://datasheet.ciiva.com/2453/pyu-r-int-thick-7-2453646.pdf?src-supplier=Digi-Key; ComponentLink3Description: https://datasheet.ciiva.com/2453/pyu-r-int-thick-7-2453646.pdf?src-supplier=Digi-Key; ComponentLink4URL: https://datasheet.ciiva.com/2453/pyu-r-int-thick-7-2453647.pdf?src-supplier=Digi-Key; ComponentLink4Description: https://datasheet.ciiva.com/2453/pyu-r-int-thick-7-2453647.pdf?src-supplier=Digi-Key
R662 = Resistor: Manufacturer 1: Panasonic; Manufacturer Part Number 1: ERA-2AED104X; Tolerance: 0.5%; Power Rating: 63mW; Voltage Rating: 25V; Temperature Coefficient: 25ppm/°C; Supplier 1: Digi-Key; Supplier Part Number 1: P100KDECT-ND; Stock 1: 54338; Pricing 1: 1=0.22000, 10=0.18800, 100=0.07350, 1000=0.03077, 2500=0.02820, 5000=0.02564 (USD); RoHS: Yes; Mount: Surface Mount; Case Code (Imperial): 0402; Case Code (Metric): 1005; Contact Plating: Tin; Min Operating Temperature: -55°C; Max Operating Temperature: 155°C; Resistance: 100kR; Packaging: Tape and Reel; Package Quantity: 10000; Composition: Metal Film,Thin Film; Number of Terminations: 2; Military Standard: Not; Termination: SMD/SMT; Max Power Dissipation: 63mW; Voltage Rating (DC): 25V; Length: 1mm; Height: 0.016inch; Width: 0.5mm; Depth: 0.5mm; Radiation Hardening: No; REACH SVHC: No SVHC; Lead Free: Lead Free; ComponentLink1URL: https://datasheet.ciiva.com/24028/aoa0000ce26-197354-24028150.pdf?src-supplier=Mouser; ComponentLink1Description: https://datasheet.ciiva.com/24028/aoa0000ce26-197354-24028150.pdf?src-supplier=Mouser; ComponentLink2URL: https://datasheet.ciiva.com/43470/1776116-43470438.pdf?src-supplier=Farnell; ComponentLink2Description: https://datasheet.ciiva.com/43470/1776116-43470438.pdf?src-supplier=Farnell; ComponentLink3URL: https://datasheet.ciiva.com/7830/1776116-7830920.pdf?src-supplier=Element14; ComponentLink3Description: https://datasheet.ciiva.com/7830/1776116-7830920.pdf?src-supplier=Element14; ComponentLink4URL: https://datasheet.ciiva.com/46378/1776116-46378234.pdf?src-supplier=Element14; ComponentLink4Description: https://datasheet.ciiva.com/46378/1776116-46378234.pdf?src-supplier=Element14; ComponentLink5URL: https://datasheet.ciiva.com/16780/70068849-16780139.pdf?src-supplier=Allied+Electronics; ComponentLink5Description: https://datasheet.ciiva.com/16780/70068849-16780139.pdf?src-supplier=Allied+Electronics; ComponentLink6URL: https://datasheet.ciiva.com/9117/aoa0000ce26-9117229.pdf?src-supplier=Avnet; ComponentLink6Description: https://datasheet.ciiva.com/9117/aoa0000ce26-9117229.pdf?src-supplier=Avnet; ComponentLink7URL: https://datasheet.ciiva.com/16511/aoa0000ce26-16511566.pdf?src-supplier=Avnet+Asia; ComponentLink7Description: https://datasheet.ciiva.com/16511/aoa0000ce26-16511566.pdf?src-supplier=Avnet+Asia; ComponentLink8URL: https://datasheet.ciiva.com/30225/54aoa0000ce26-30225311.pdf?src-supplier=Onlinecomponents.com; ComponentLink8Description: https://datasheet.ciiva.com/30225/54aoa0000ce26-30225311.pdf?src-supplier=Onlinecomponents.com
T32 = RJK0651DPB-00#J5: MOSFET N-CH 60V 25A LFPAK; Manufacturer: Renesas; Rise Time: 4.4ns; Turn-On Delay Time: 8.4ns; Turn-Off Delay Time: 42ns; Fall Time: 6.8ns; Gate to Source Voltage (Vgs): 20V; Rds On Max: 14mR; Input Capacitance: 2.03nF; Max Power Dissipation: 45W; Number of Elements: 1; Supplier 1: Mouser; Manufacturer Part Number: RJK0651DPB-00#J5; RoHS: Yes; Category: MOSFETs; Stock 1: 1853; Pricing 1: 1=1,29000, 10=1,15000, 25=1,11000, 100=0,90000, 250=0,85900, 500=0,73200 (USD); Mount: Surface Mount; Number of Pins: 5; Min Operating Temperature: -55°C; Max Operating Temperature: 150°C; Continuous Drain Current (ID): 25A; Package Quantity: 1; Packaging: Tape and Reel; Drain to Source Voltage (Vdss): 60V; Power Dissipation: 45W; Drain to Source Resistance: 14MR; Radiation Hardening: No; Lead Free: Lead Free; ComponentLink1URL: https://datasheet.ciiva.com/16481/r07ds0076ej0200-rjk0651dpb-16481749.pdf?src-supplier=Future+Electronics; ComponentLink1Description: https://datasheet.ciiva.com/16481/r07ds0076ej0200-rjk0651dpb-16481749.pdf?src-supplier=Future+Electronics
T33 = SIJ482DP-T1-GE3: MOSFET 80V 6.2mOhm@10V 60A N-Ch MV T-FET; Manufacturer: Vishay; Rds On Max: 6.2mR; Input Capacitance: 2.425nF; Gate to Source Voltage (Vgs): 20V; Power Dissipation: 69.4W; Turn-Off Delay Time: 72ns; Number of Elements: 1; Element Configuration: Single; On-State Resistance: 9.5MR; Turn-On Delay Time: 28ns; Threshold Voltage: 1.5V; Supplier 1: Digi-Key; Manufacturer Part Number: SIJ482DP-T1-GE3; RoHS: Yes; Category: MOSFETs; Stock 1: 1756; Pricing 1: 1=1,76000, 10=1,58300, 25=1,49360, 100=1,16490, 250=1,13508, 500=0,98572, 1000=0,83636 (USD); Mount: Through Hole,Surface Mount; Number of Pins: 5; Min Operating Temperature: -55°C; Max Operating Temperature: 150°C; Packaging: Tape and Reel; Package Quantity: 1; Drain to Source Resistance: 6.2mR; Drain to Source Breakdown Voltage: 80V; Continuous Drain Current (ID): 60A; Drain to Source Voltage (Vdss): 80V; Max Power Dissipation: 69.4W; Length: 5mm; Height: 1.14mm; Width: 4.47mm; Radiation Hardening: No; Lead Free: Lead Free; REACH SVHC: Unknown; ComponentLink1URL: https://datasheet.ciiva.com/30021/sij482dp-30021697.pdf?src-supplier=Avnet; ComponentLink1Description: https://datasheet.ciiva.com/30021/sij482dp-30021697.pdf?src-supplier=Avnet; ComponentLink2URL: https://datasheet.ciiva.com/4438/sij482dp-104025-4438550.pdf?src-supplier=Mouser; ComponentLink2Description: https://datasheet.ciiva.com/4438/sij482dp-104025-4438550.pdf?src-supplier=Mouser; ComponentLink3URL: https://datasheet.ciiva.com/16486/sij482dp-16486587.pdf?src-supplier=Future+Electronics; ComponentLink3Description: https://datasheet.ciiva.com/16486/sij482dp-16486587.pdf?src-supplier=Future+Electronics; ComponentLink4URL: https://datasheet.ciiva.com/6369/sij482dp-6369549.pdf?src-supplier=Digi-Key; ComponentLink4Description: https://datasheet.ciiva.com/6369/sij482dp-6369549.pdf?src-supplier=Digi-Key
U66 = MAX17557ATP+: IC REG CTRLR BUCK 20-TQFN; Manufacturer: Maxim; Supplier 1: Digi-Key; Manufacturer Part Number: MAX17557ATP+; Stock 1: 460; Pricing 1: 1 = 3,92000, 10 = 3,52200, 25 = 3,33000, 100 = 2,73800, 250 = 2,45680, 500 = 2,36800, 1000 = 2,22000 (USD); RoHS: No; ComponentLink1URL: https://datasheets.maximintegrated.com/en/ds/MAX17557.pdf?src-supplier=Digi-Key; ComponentLink1Description: https://datasheets.maximintegrated.com/en/ds/MAX17557.pdf?src-supplier=Digi-Key